# Altium schematic sheet Charging-Sheet.SchDoc
size A4; SheetNumber: 6; SheetTotal: 6
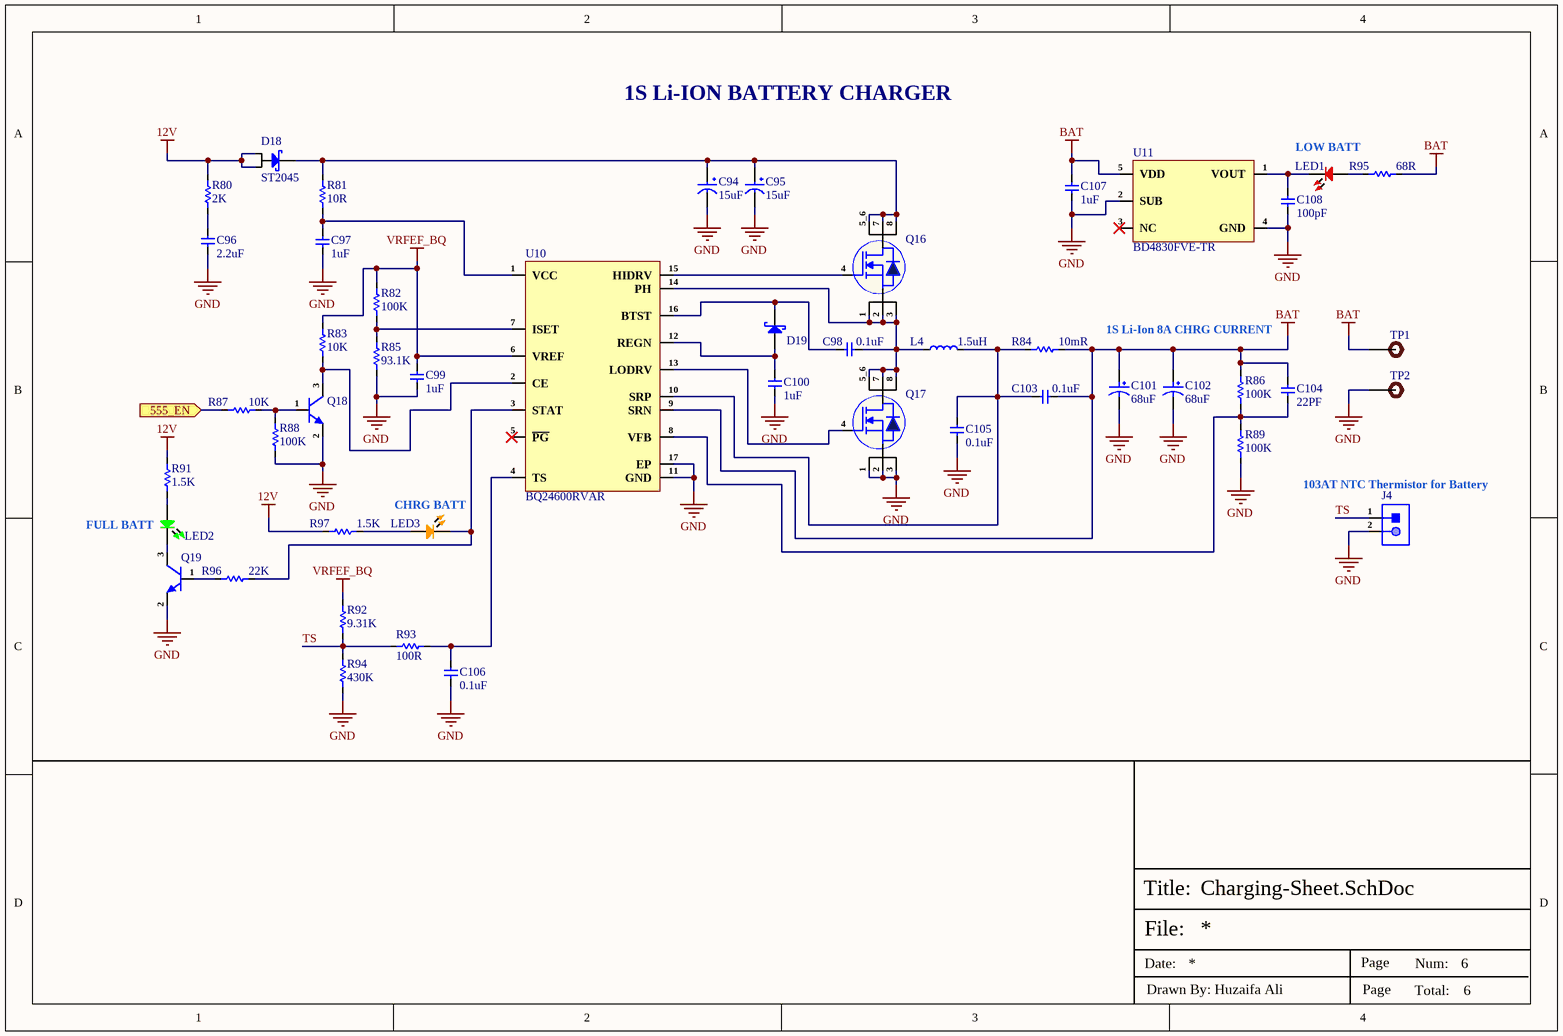
[diagram p0: Charging-Sheet.SchDoc]

## Parts
C94  15uF  [UUD1V150MCL1GS]
C95  15uF  [UUD1V150MCL1GS]
C96  2.2uF  [Cap-0603]
C97  1uF  [Cap-0603]
C98  0.1uF  [CAP-0603]
C99  1uF  [Cap-0603]
C100  1uF  [Cap-0603]
C101  68uF  [50SVPF68M]
C102  68uF  [50SVPF68M]
C103  0.1uF  [CAP-0603]
C104  22PF  [Cap-0402]
C105  0.1uF  [CAP-0603]
C106  0.1uF  [CAP-0603]
C107  1uF  [Cap-0603]
C108  100pF  [Cap-0402]
D18  ST2045  [TO-277]
D19  SS24A  [SMA]  (value not drawn)
J4  X6511WV-02H-C60D30  [HDR1X2_]  (value not drawn)
L4  1.5uH  [FAUL1350-1R5MT]
LED1  RED  [LED-0603]  (value not drawn)
LED2  Emerald  [LED-0603]  (value not drawn)
LED3  NCD0603O2  [LED-0603]  (value not drawn)
Q16  SIR426DP-T1-GE3  [PowerPAK-SO-8]  (value not drawn)
Q17  SIR426DP-T1-GE3  [PowerPAK-SO-8]  (value not drawn)
Q18  MMBT3904M  [SOT-723]  (value not drawn)
Q19  MMBT3904M  [SOT-723]  (value not drawn)
R80  2K  [Res-0603]
R81  10R  [Res-0603]
R82  100K  [Res-0603]
R83  10K  [Res-0603]
R84  10mR  [RES-2512]
R85  93.1K  [Res-0603]
R86  100K  [Res-0603]
R87  10K  [Res-0402]
R88  100K  [Res-0402]
R89  100K  [Res-0603]
R91  1.5K  [Res-0402]
R92  9.31K  [Res-0603]
R93  100R  [Res-0603]
R94  430K  [Res-0603]
R95  68R  [Res-0201]
R96  22K  [Res-0201]
R97  1.5K  [Res-0402]
TP1  Th Hole Test Point (3.7mm Drill 6mm pad)  [Th Hole Test Point (3.7mm Drill 6mm pad)]  (value not drawn)  (no BOM)
TP2  Th Hole Test Point (3.7mm Drill 6mm pad)  [Th Hole Test Point (3.7mm Drill 6mm pad)]  (value not drawn)  (no BOM)
U10  BQ24600RVAR  [QFN-16-EP(3.6x3.6)]
U11  BD4830FVE-TR  [5-VSOF]

## Ports
555_EN (in, see Relay-Switch-Sheet[2B])

## Nets
12V: D18.1(A1) D18.3(A2) R80.2 R91.2 R97.2
BAT: C101.1 C102.1 C103.1 C104.2 C107.2 R84.2 R86.2 R95.2 TP1.1 U10.9(SRN) U11.5(VDD)
GND: C94.2 C95.2 C96.2 C97.1 C99.1 C100.1 C101.2 C102.2 C105.2 C106.2 C107.1 C108.1 J4.2 Q17.1(S) Q17.2(S) Q17.3(S) Q18.2(E) Q19.2(E) R85.1 R88.1 R89.1 R94.1 TP2.1 U10.11(GND) U10.17(EP) U11.2(SUB) U11.4(GND)
VRFEF_BQ: C99.2 R82.2 R83.2 R92.2 U10.6(VREF)
555_EN: R87.2 ; port 555_EN
TS: J4.1 R92.1 R93.1 R94.2
NetC94_1: C94.1 C95.1 D18.2(K) Q16.5_6(D) Q16.7(D) Q16.8(D) R81.2
NetC96_1: C96.1 R80.1
NetC97_2: C97.2 R81.1 U10.1(VCC)
NetC98_1: C98.1 L4.1 Q16.1(S) Q16.2(S) Q16.3(S) Q17.5_6(D) Q17.7(D) Q17.8(D) U10.14(PH)
NetC98_2: C98.2 D19.1(K) U10.16(BTST)
NetC100_2: C100.2 D19.2(A) U10.12(REGN)
NetC103_2: C103.2 C105.1 L4.2 R84.1 U10.10(SRP)
NetC104_1: C104.1 R86.1 R89.2 U10.8(VFB)
NetC106_1: C106.1 R93.2 U10.4(TS)
NetC108_2: C108.2 LED1.2 U11.1(VOUT)
NetLED1_1: LED1.1 R95.1
NetLED2_1: LED2.1 R91.1
NetLED2_2: LED2.2 Q19.3(C)
NetLED3_1: LED3.1 R97.1
NetLED3_2: LED3.2 R96.2 U10.3(STAT)
NetQ16_4: Q16.4(G) U10.15(HIDRV)
NetQ17_4: Q17.4(G) U10.13(LODRV)
NetQ18_1: Q18.1(B) R87.1 R88.2
NetQ18_3: Q18.3(C) R83.1 U10.2(CE)
NetQ19_1: Q19.1(B) R96.1
NetR82_1: R82.1 R85.2 U10.7(ISET)

Not connected (* = marked no-connect by the designer): U10 5(~{PG})*; U11 3(NC)*

## Notes on the sheet
- 1S Li-ION BATTERY CHARGER
- LOW BATT
- 1S Li-Ion 8A CHRG CURRENT
- FULL BATT
- (near LED3) CHRG BATT
- (near J4) 103AT NTC Thermistor for Battery
- File:
- Title:
- Date:
- Page
- Num:
- Total:
- Drawn By: Huzaifa Ali

## Library data of the parts
C94 C95 = UUD1V150MCL1GS: CAP ALUM 15UF 20% 35V SMD; Manufacturer: Nichicon; Dielectric Material: Aluminium; Ripple Current: 150mA; Impedance: 760mR; Leakage Current: 5.25uA; Life (Hours): 2000Hour; Item Type: Capacitor; Supplier 1: Arrow Electronics; Manufacturer Part Number: UUD1V150MCL1GS; RoHS: Yes; Category: Aluminum Electrolytic Capacitors; Stock 1: 1; Pricing 1: 1=0.1001 (USD); Case/Package: Radial; Pins: 2; Min Operating Temperature: -55°C; Max Operating Temperature: 105°C; Package Quantity: 1000; Voltage Rating (DC): 35V; Tolerance: 20%; Packaging: Tape and Reel; Value: 15uF; Voltage Rating: 35V; Termination: SMD/SMT; Series: UD; Construction: Cylindrical; Diameter: 5mm; Length: 5.8mm; Height: 5.8mm; Radiation Hardening: No; Lead Free: Lead Free; RoHS Compliant: Yes; ComponentLink1URL: https://datasheet.ciiva.com/96/e-ud-96810.pdf?src-supplier=Digi-Key; ComponentLink1Description: https://datasheet.ciiva.com/96/e-ud-96810.pdf?src-supplier=Digi-Key; ComponentLink2URL: https://datasheet.ciiva.com/96/e-ud-96811.pdf?src-supplier=Digi-Key; ComponentLink2Description: https://datasheet.ciiva.com/96/e-ud-96811.pdf?src-supplier=Digi-Key; ComponentLink3URL: https://datasheet.ciiva.com/96/e-ud-96812.pdf?src-supplier=Digi-Key; ComponentLink3Description: https://datasheet.ciiva.com/96/e-ud-96812.pdf?src-supplier=Digi-Key; Supplier Part Number 1: UUD1V150MCL1GS; LCSC Part Number: C445253
C96 = GRM188R6YA225KA12D: CAP, 2.2µF, 35V, 10%, X5R, 0603; Manufacturer: Murata; Material: Ceramic; Item Type: Capacitor; Supplier 1: Digi-Key; Manufacturer Part Number: GRM188R6YA225KA12D; RoHS: Yes; Category: Ceramic Capacitors; Stock 1: 81665; Pricing 1: 1=0.21000, 10=0.14100, 50=0.08480, 100=0.07170, 500=0.04904, 1000=0.04338 (USD); Mount: Surface Mount; Case/Package: 0603; Case Code (Metric): 1608; Case Code (Imperial): 0603; Weight: 0.000222oz; Min Operating Temperature: -55°C; Max Operating Temperature: 85°C; Package Quantity: 4000; Packaging: Tape and Reel; Capacitance: 2.2uF; Tolerance: 10%; Voltage Rating: 35V; Dielectric: X5R; Voltage: 35V; Termination: SMD/SMT; Voltage Rating (DC): 35V; Series: GRM; Length: 1.6mm; Width: 0.8mm; Height: 0.8mm; Thickness: 0.035inch; Depth: 0.8mm; REACH SVHC: No SVHC; Lead Free: Lead Free; RoHS Compliant: Yes; ComponentLink1URL: https://datasheet.ciiva.com/14906/partnumbering-e-01-14906490.pdf?src-supplier=Digi-Key; ComponentLink1Description: https://datasheet.ciiva.com/14906/partnumbering-e-01-14906490.pdf?src-supplier=Digi-Key; ComponentLink2URL: https://datasheet.ciiva.com/14906/partnumbering-e-01-14906491.pdf?src-supplier=Digi-Key; ComponentLink2Description: https://datasheet.ciiva.com/14906/partnumbering-e-01-14906491.pdf?src-supplier=Digi-Key; ComponentLink3URL: https://datasheet.ciiva.com/14906/partnumbering-e-01-14906492.pdf?src-supplier=Digi-Key; ComponentLink3Description: https://datasheet.ciiva.com/14906/partnumbering-e-01-14906492.pdf?src-supplier=Digi-Key; Supplier Part Number 1: 490-7204-1-ND; LCSC Part Number: C86017
C97 C99 C100 C107 = CL10A105KB8NNNC: CAP CER 1UF 50V X5R 0603; Manufacturer: Samsung; Material: 4241ConductorMaterial; Tolerance: 10%; Item Type: Capacitor; Supplier: Avnet; Supplier Part Number: CL10A105KB8NNNC; Manufacturer Part Number: CL10A105KB8NNNC; RoHS: Yes; Category: Ceramic Capacitors; Stock: 780446; Pricing: 4000=0.01632, 8000=0.01595, 16000=0.01557, 24000=0.0152, 32000=0.01482 (USD); Mounting Technology: Surface Mount; Case/Package: 0603; Case Code (Metric): 1608; Case Code (Imperial): 0603; Min Operating Temperature: -55°C; Max Operating Temperature: 85°C; Packaging: Tape and Reel; Value: 1uF; Voltage Rating: 50V; Dielectric: X5R; Series: CL; Voltage Rating (DC): 50V; Length: 1.6mm; Depth: 0.8mm; Radiation Hardening: No; RoHS Compliant: Yes; ComponentLink1URL: https://datasheet.ciiva.com/26877/getdatasheetpartid-753736-26877879.pdf?src-supplier=Verical; ComponentLink1Description: https://datasheet.ciiva.com/26877/getdatasheetpartid-753736-26877879.pdf?src-supplier=Verical; LCSC Part Number: C15849
C98 C103 C105 C106 = CL10B104KB8NNNL: CAP CER 0.1UF 50V X7R 0603; Manufacturer: Samsung; Capacitance: 100nF; Tolerance: 10%; Item Type: Capacitor; Supplier 1: Digi-Key; Manufacturer Part Number: CL10B104KB8NNNL; Stock 1: 3731229; Pricing 1: 1=0.1, 10=0.03, 50=0.0164, 100=0.0134, 500=0.00958, 1000=0.00753, 2500=0.00684, 5000=0.0063 (USD); Mount: Surface Mount; Case/Package: 0603; Min Operating Temperature: -55°C; Max Operating Temperature: 125°C; Dielectric: X7R; Packaging: Tape and Reel; Package Quantity: 15000; Voltage Rating: 50V; Voltage Rating (DC): 50V; Series: CL; Construction: Flat; Length: 1.6mm; Width: 0.031inch; Height: 0.8mm; Thickness: 0.035inch; Depth: 0.8mm; Radiation Hardening: No; RoHS Compliant: Yes; ComponentLink1URL: https://www.verical.com/server-webapp/html/getDatasheet?partID=357523&src-supplier=Verical; ComponentLink1Description: https://www.verical.com/server-webapp/html/getDatasheet?partID=357523&src-supplier=Verical; ComponentLink2URL: https://media.digikey.com/pdf/Data%20Sheets/Samsung%20PDFs/CL_Series_MLCC_ds.pdf?src-supplier=Digi-Key; ComponentLink2Description: https://media.digikey.com/pdf/Data%20Sheets/Samsung%20PDFs/CL_Series_MLCC_ds.pdf?src-supplier=Digi-Key; Supplier Part Number 1: 1276-CL10B104KB8NNNLCT-ND; LCSC Part Number: C913912
C101 C102 = 50SVPF68M: CAP ALUM POLY 68UF 20% 50V SMD; Manufacturer: Panasonic; Item Type: Capacitors; Material: 4242ConductorMaterial; Supplier: Future Electronics; LCSC Part Number: C178375; Manufacturer Part Number: 50SVPF68M; RoHS: Yes; Stock: 8800; Pricing: 400=1.08, 800=1.05, 1200=1.03, 1600=1.02, 2000=0.985 (USD); ComponentLink1URL: https://datasheet.ciiva.com/25761/1734360-25761295.pdf?src-supplier=Farnell; ComponentLink1Description: https://datasheet.ciiva.com/25761/1734360-25761295.pdf?src-supplier=Farnell; ComponentLink2URL: https://datasheet.ciiva.com/24071/svpf-os-262415-24071528.pdf?src-supplier=Mouser; ComponentLink2Description: https://datasheet.ciiva.com/24071/svpf-os-262415-24071528.pdf?src-supplier=Mouser; ComponentLink3URL: https://datasheet.ciiva.com/22746/1734360-22746280.pdf?src-supplier=Element14; ComponentLink3Description: https://datasheet.ciiva.com/22746/1734360-22746280.pdf?src-supplier=Element14
C104 = CC0402JRNPO9BN220: CAP CER 22PF 50V C0G/NPO 0402; Manufacturer: Yageo; Dielectric Material: Ceramic; Tolerance: 5%; Dielectric: C0G; Temperature Coefficient: 30ppm/°C; Insulation Resistance: 100GR; Item Type: Capacitor; Supplier 1: Future Electronics; Manufacturer Part Number: CC0402JRNPO9BN220; RoHS: Yes; Category: Ceramic Capacitors; Stock 1: 200000; Pricing 1: 10000=0.00220, 40000=0.00210, 150000=0.00200, 400000=0.00190, 1000000=0.00180 (USD); Mounting Technology: Surface Mount; Case/Package: 0402; Pins: 2; Case Code (Metric): 1005; Case Code (Imperial): 0402; Min Operating Temperature: -55°C; Max Operating Temperature: 125°C; Value: 22pF; Voltage Rating: 50V; Packaging: Tape and Reel; Package Quantity: 1; Voltage Rating (DC): 50V; Termination: SMD/SMT; Resistor Type: Ceramic; Voltage: 50V; Series: CC; Length: 1mm; Width: 0.02inch; Height: 0.5mm; Thickness: 0.022inch; Depth: 0.5mm; Radiation Hardening: No; Reach SVHC Compliant: Yes; Lead Free: Lead Free; RoHS Compliant: Yes; ComponentLink1URL: https://datasheet.ciiva.com/5789/1443161-5789509.pdf?src-supplier=Farnell; ComponentLink1Description: https://datasheet.ciiva.com/5789/1443161-5789509.pdf?src-supplier=Farnell; ComponentLink2URL: https://datasheet.ciiva.com/8033/1443161-8033606.pdf?src-supplier=Element14; ComponentLink2Description: https://datasheet.ciiva.com/8033/1443161-8033606.pdf?src-supplier=Element14; ComponentLink3URL: https://datasheet.ciiva.com/7656/1132289-7656615.pdf?src-supplier=Element14; ComponentLink3Description: https://datasheet.ciiva.com/7656/1132289-7656615.pdf?src-supplier=Element14; ComponentLink4URL: https://datasheet.ciiva.com/8033/1443161-8033607.pdf?src-supplier=Element14; ComponentLink4Description: https://datasheet.ciiva.com/8033/1443161-8033607.pdf?src-supplier=Element14; ComponentLink5URL: https://datasheet.ciiva.com/8033/1443161-8033605.pdf?src-supplier=Element14; ComponentLink5Description: https://datasheet.ciiva.com/8033/1443161-8033605.pdf?src-supplier=Element14; ComponentLink6URL: https://datasheet.ciiva.com/143/mlccorderingcode-143987.pdf?src-supplier=Digi-Key; ComponentLink6Description: https://datasheet.ciiva.com/143/mlccorderingcode-143987.pdf?src-supplier=Digi-Key; ComponentLink7URL: https://datasheet.ciiva.com/143/mlccorderingcode-143986.pdf?src-supplier=Digi-Key; ComponentLink7Description: https://datasheet.ciiva.com/143/mlccorderingcode-143986.pdf?src-supplier=Digi-Key; ComponentLink8URL: https://datasheet.ciiva.com/143/mlccorderingcode-143988.pdf?src-supplier=Digi-Key; ComponentLink8Description: https://datasheet.ciiva.com/143/mlccorderingcode-143988.pdf?src-supplier=Digi-Key; ComponentLink9URL: https://datasheet.ciiva.com/5425/upy-gp-np0-16v-to-50v-8-5425483.pdf?src-supplier=Mouser; ComponentLink9Description: https://datasheet.ciiva.com/5425/upy-gp-np0-16v-to-50v-8-5425483.pdf?src-supplier=Mouser; ComponentLink10URL: https://datasheet.ciiva.com/15189/getdatasheetpartid-370074-15189117.pdf?src-supplier=Verical; ComponentLink10Description: https://datasheet.ciiva.com/15189/getdatasheetpartid-370074-15189117.pdf?src-supplier=Verical; Supplier Part Number 1: 9105957; LCSC Part Number: C106203
C108 = CC0402JRNPO9BN101: CAP CER 100PF 50V C0G/NPO 0402; Manufacturer: Yageo; Dielectric Material: Ceramic; Tolerance: 5%; Dielectric: C0G; Temperature Coefficient: 30ppm/°C; Insulation Resistance: 100GR; Item Type: Capacitor; Supplier: Future Electronics; Supplier Part Number: 8934564; Manufacturer Part Number: CC0402JRNPO9BN101; RoHS: Yes; Category: Ceramic Capacitors; Stock: 11720000; Pricing: 10000=0.002, 40000=0.0019, 150000=0.0018, 400000=0.0018, 1000000=0.0017 (USD); Mounting Technology: Surface Mount; Case/Package: 0402; Pins: 2; Case Code (Imperial): 0402; Case Code (Metric): 1005; Min Operating Temperature: -55°C; Max Operating Temperature: 125°C; Value: 100pF; Voltage Rating: 50V; Voltage Rating (DC): 50V; Packaging: Tape and Reel; Package Quantity: 1; Termination: SMD/SMT; Voltage: 50V; Series: CC; Length: 1mm; Width: 0.02inch; Height: 0.5mm; Thickness: 0.022inch; Depth: 0.5mm; Radiation Hardening: No; RoHS Compliant: Yes; Reach SVHC Compliant: No; Lead Free: Lead Free; ComponentLink1URL: https://datasheet.ciiva.com/11786/0900766b80d84fbf-11786101.pdf?src-supplier=Rs; ComponentLink1Description: https://datasheet.ciiva.com/11786/0900766b80d84fbf-11786101.pdf?src-supplier=Rs; ComponentLink2URL: https://datasheet.ciiva.com/23767/25787-23767888.pdf?src-supplier=Newark; ComponentLink2Description: https://datasheet.ciiva.com/23767/25787-23767888.pdf?src-supplier=Newark; ComponentLink3URL: https://datasheet.ciiva.com/28450/1443161-28450220.pdf?src-supplier=Element14; ComponentLink3Description: https://datasheet.ciiva.com/28450/1443161-28450220.pdf?src-supplier=Element14; ComponentLink4URL: https://datasheet.ciiva.com/8033/1443161-8033598.pdf?src-supplier=Element14; ComponentLink4Description: https://datasheet.ciiva.com/8033/1443161-8033598.pdf?src-supplier=Element14; ComponentLink5URL: https://datasheet.ciiva.com/143/mlccorderingcode-143990.pdf?src-supplier=Digi-Key; ComponentLink5Description: https://datasheet.ciiva.com/143/mlccorderingcode-143990.pdf?src-supplier=Digi-Key; ComponentLink6URL: https://datasheet.ciiva.com/143/mlccorderingcode-143989.pdf?src-supplier=Digi-Key; ComponentLink6Description: https://datasheet.ciiva.com/143/mlccorderingcode-143989.pdf?src-supplier=Digi-Key; ComponentLink7URL: https://datasheet.ciiva.com/143/mlccorderingcode-143991.pdf?src-supplier=Digi-Key; ComponentLink7Description: https://datasheet.ciiva.com/143/mlccorderingcode-143991.pdf?src-supplier=Digi-Key; LCSC Part Number: C106200
D18 = ST2045: 45V Independent Type 20A 470mV@20A TO-277 Schottky Diodes ROHS; Manufacturer: MDD; Item Type: Diode; Manufacturer Part Number: ST2045; Package: TO-277; LCSC Part Number: C840773; ComponentLink1Description: LCSC; ComponentLink1URL: https://www.lcsc.com/product-detail/Schottky-Diodes_MDD-Microdiode-Semiconductor-ST2045_C840773.html
D19 = SS24A: 40V 500mV@2A 2A SMA(DO-214AC) Schottky Barrier Diodes (SBD) ROHS; Manufacturer: Guangdong Hottech; Manufacturer Part Number: SS24A; Package: SMA(DO-214AC); LCSC Part Number: C2886579; ComponentLink1Description: LCSC; ComponentLink1URL: https://www.lcsc.com/product-detail/Schottky-Barrier-Diodes-SBD_Guangdong-Hottech-SS24A_C2886579.html
J4 = X6511WV-02H-C60D30: Gold 250V 3A Straight Square Pins 2.5mm 2P 260℃ 6mm -40℃~+105℃ 3mm 2.54mm Plugin Black Brass 1x2P Plugin,P=2.54mm Pin Headers ROHS; Manufacturer: XKB; Item Type: Male Header; Manufacturer Part Number: X6511WV-02H-C60D30; Package: Plugin,P=2.54mm; LCSC Part Number: C706874; ComponentLink1Description: LCSC; ComponentLink1URL: https://www.lcsc.com/product-detail/Pin-Headers_XKB-Connectivity-X6511WV-02H-C60D30_C706874.html
L4 = FAUL1350-1R5MT: 23A 1.5uH Integrated molded inductor ±20% 33A SMD,12.6x13.5mm Power Inductors ROHS; Manufacturer: cjiang; Manufacturer Part Number: FAUL1350-1R5MT; Package: SMD,12.6x13.5mm; LCSC Part Number: C5298318; Item Type: Inductors; ComponentLink1Description: LCSC; ComponentLink1URL: https://www.lcsc.com/product-detail/Power-Inductors_cjiang-Changjiang-Microelectronics-Tech-FAUL1350-1R5MT_C5298318.html
LED1 = NCD0603R3: RED LED 0603 Light Emitting Diodes; Manufacturer: Foshan NationStar Optoelectronics; Manufacturer Part Number: NCD0603R3; Package: 0603; Item Type: LED; LCSC Part Number: C3151730; ComponentLink1Description: LCSC; ComponentLink1URL: https://www.lcsc.com/product-detail/Light-Emitting-Diodes-LED_Foshan-NationStar-Optoelectronics-NCD0603R3_C3151730.html
LED2 = NCD0603G2: Emerald 0603 Light Emitting Diodes (LED) ROHS; Manufacturer: Foshan NationStar Optoelectronics; Manufacturer Part Number: NCD0603G2; Package: 0603; LCSC Part Number: C87326; Item Type: LED; ComponentLink1Description: LCSC; ComponentLink1URL: https://www.lcsc.com/product-detail/Light-Emitting-Diodes-LED_Foshan-NationStar-Optoelectronics-NCD0603G2_C87326.html
LED3 = NCD0603O2: 20mA 100mcd~220mcd 600nm~610nm -30℃~+85℃ Orange 130° 65mW 1.6V~2.6V 0603 Light Emitting Diodes (LED) ROHS; Manufacturer: FOSHAN Nationstar Optoelectronics; Supplier: LCSC; LCSC Part Number: C108553; Manufacturer Part Number: NCD0603O2; RoHS: No; Item Type: LED
Q16 Q17 = SIR426DP-T1-GE3: MOSFET N-CH 40V 30A PPAK SO-8; Manufacturer: Vishay; Item Type: MOSFETs; Supplier: Mouser; LCSC Part Number: C52893; Manufacturer Part Number: SIR426DP-T1-GE3; RoHS: Yes; Stock: 68474; Pricing: 1=1, 10=0.818, 50=0.818, 100=0.637, 1000=0.44, 10000=0.375 (USD); Height: 1.12mm; Lead Free: 5697LeadFree; ComponentLink1URL: https://datasheet.ciiva.com/6387/sir426dp-6387168.pdf?src-supplier=Digikey; ComponentLink1Description: https://datasheet.ciiva.com/6387/sir426dp-6387168.pdf?src-supplier=Digikey; ComponentLink2URL: https://datasheet.ciiva.com/4440/sir426dp-244407-4440641.pdf?src-supplier=Mouser; ComponentLink2Description: https://datasheet.ciiva.com/4440/sir426dp-244407-4440641.pdf?src-supplier=Mouser; ComponentLink3URL: https://datasheet.ciiva.com/28599/1750667-28599683.pdf?src-supplier=Element14; ComponentLink3Description: https://datasheet.ciiva.com/28599/1750667-28599683.pdf?src-supplier=Element14; ComponentLink4URL: https://datasheet.ciiva.com/5774/sir426dp-5774022.pdf?src-supplier=Farnell; ComponentLink4Description: https://datasheet.ciiva.com/5774/sir426dp-5774022.pdf?src-supplier=Farnell; ComponentLink5URL: https://datasheet.ciiva.com/6387/sir426dp-6387166.pdf?src-supplier=Digikey; ComponentLink5Description: https://datasheet.ciiva.com/6387/sir426dp-6387166.pdf?src-supplier=Digikey; ComponentLink6URL: https://datasheet.ciiva.com/11159/sir426dp-11159834.pdf?src-supplier=Avnet; ComponentLink6Description: https://datasheet.ciiva.com/11159/sir426dp-11159834.pdf?src-supplier=Avnet; ComponentLink7URL: https://datasheet.ciiva.com/16486/sir426dp-16486778.pdf?src-supplier=Future+Electronics; ComponentLink7Description: https://datasheet.ciiva.com/16486/sir426dp-16486778.pdf?src-supplier=Future+Electronics
Q18 Q19 = MMBT3904M: 40V 100mW 100@10mA,1V 200mA 300MHz 300mV@50mA,5mA NPN -55℃~+150℃@(Tj) SOT-723 Bipolar Transistors - BJT ROHS; Manufacturer: TECH PUBLIC; Item Type: Mosfet; ComponentLink1Description: LCSC; ComponentLink1URL: https://www.lcsc.com/product-detail/Bipolar-Transistors-BJT_TECH-PUBLIC-MMBT3904M_C2923360.html; Manufacturer Part Number: MMBT3904M; Package: SOT-723; LCSC Part Number: C2923360
R80 = RC0603FR-072KL: RES SMD 2K OHM 1% 1/10W 0603; Manufacturer: Yageo; Resistance: 2kR; Temperature Coefficient: 100ppm/°C; Voltage Rating (DC): 50V; Power Rating: 100mW; Working Voltage: 75V; Supplier 1: Digi-Key; Manufacturer Part Number: RC0603FR-072KL; Stock 1: 8782961; Pricing 1: 1=0.1, 10=0.023, 100=0.0094, 1000=0.00421, 2500=0.00366 (USD); Case/Package: 0603; Number of Pins: 2; Case Code (Metric): 1608; Case Code (Imperial): 0603; Min Operating Temperature: -55°C; Max Operating Temperature: 155°C; Tolerance: 1%; Composition: Thick Film; Packaging: Tape and Reel; Voltage Rating: 50V; Package Quantity: 1; Number of Terminations: 2; Termination: SMD/SMT; Military Standard: Not; Max Power Dissipation: 100mW; Features: Moisture Resistant; Length: 1.6mm; Height: 0.45mm; Width: 0.031inch; Depth: 0.8mm; Lead Free: Lead Free; REACH SVHC: No SVHC; ComponentLink1URL: http://www.farnell.com/datasheets/2167052.pdf?src-supplier=Element14; ComponentLink1Description: http://www.farnell.com/datasheets/2167052.pdf?src-supplier=Element14; ComponentLink2URL: http://documents.rs-components.com/techlib://itc_doclist_GB.htm?stockno=5050139&src-supplier=RSComponents; ComponentLink2Description: http://documents.rs-components.com/techlib://itc_doclist_GB.htm?stockno=5050139&src-supplier=RSComponents; ComponentLink3URL: http://www.yageo.com/documents/recent/PYu-RC_Group_51_RoHS_L_10.pdf?src-supplier=Digi-Key; ComponentLink3Description: http://www.yageo.com/documents/recent/PYu-RC_Group_51_RoHS_L_10.pdf?src-supplier=Digi-Key; ComponentLink4URL: http://www.mouser.com/catalog/specsheets/RC0603.pdf?src-supplier=Mouser; ComponentLink4Description: http://www.mouser.com/catalog/specsheets/RC0603.pdf?src-supplier=Mouser; Supplier Part Number 1: 311-2.00KHRCT-ND; LCSC Part Number: C105576
R81 = RC0603FR-0710RL: RES SMD 10 OHM 1% 1/10W 0603; Manufacturer: Yageo; Temperature Coefficient: 200ppm/°C; Power Rating: 100mW; Voltage Rating: 50V; Item type: Resistor; Supplier 1: Digi-Key; Manufacturer Part Number: RC0603FR-0710RL; Stock 1: 10836596; Pricing 1: 1=0.1, 10=0.046, 100=0.0187, 1000=0.0084, 2500=0.00729 (USD); Case/Package: 0603; Number of Pins: 2; Case Code (Imperial): 0603; Case Code (Metric): 1608; Contact Plating: Tin,Matte; Min Operating Temperature: -55°C; Max Operating Temperature: 155°C; Resistance: 10R; Tolerance: 1%; Composition: Thick Film; Packaging: Tape and Reel; Voltage Rating (DC): 50V; Termination: SMD/SMT; Military Standard: Not; Length: 1.6mm; Height: 0.45mm; Width: 0.8mm; Depth: 0.8mm; Radiation Hardening: No; Lead Free: Lead Free; REACH SVHC: No SVHC; ComponentLink1URL: http://www.farnell.com/datasheets/1868787.pdf?src-supplier=Element14; ComponentLink1Description: http://www.farnell.com/datasheets/1868787.pdf?src-supplier=Element14; ComponentLink2URL: http://www.yageo.com/documents/recent/PYu-RC0603_51_RoHS_L_4.pdf?src-supplier=Avnet; ComponentLink2Description: http://www.yageo.com/documents/recent/PYu-RC0603_51_RoHS_L_4.pdf?src-supplier=Avnet; ComponentLink3URL: http://documents.rs-components.com/techlib://itc_doclist_GB.htm?stockno=5048984&src-supplier=RSComponents; ComponentLink3Description: http://documents.rs-components.com/techlib://itc_doclist_GB.htm?stockno=5048984&src-supplier=RSComponents; ComponentLink4URL: http://www.yageo.com/documents/recent/PYu-RC0603_51_RoHS_L_4.pdf?src-supplier=Avnet+Europe; ComponentLink4Description: http://www.yageo.com/documents/recent/PYu-RC0603_51_RoHS_L_4.pdf?src-supplier=Avnet+Europe; Supplier Part Number 1: 311-10.0HRDKR-ND; LCSC Part Number: C109318
R82 R86 R89 = RT0603BRD07100KL: RES SMD 100K OHM 0.1% 1/10W 0603; Manufacturer: Yageo; Resistance: 100kR; Temperature Coefficient: 25ppm/°C; Voltage Rating (DC): 75V; Power Rating: 100mW; Item Type: Resistor; Supplier 1: Digi-Key; Manufacturer Part Number: RT0603BRD07100KL; Stock 1: 53395; Pricing 1: 1=0.39, 10=0.332, 100=0.1298, 1000=0.05435, 2500=0.04982 (USD); Mount: Surface Mount; Case/Package: 0603; Case Code (Imperial): 0603; Case Code (Metric): 1608; Min Operating Temperature: -55°C; Max Operating Temperature: 125°C; Tolerance: 0.1%; Composition: Thin Film; Packaging: Tape and Reel; Voltage Rating: 75V; Package Quantity: 5000; Termination: SMD/SMT; Number of Terminations: 2; Military Standard: Not; Max Power Dissipation: 100mW; Working Voltage: 75V; Features: Moisture Resistant; Length: 1.6mm; Height: 0.022inch; Width: 0.031inch; Depth: 0.8mm; Lead Free: Lead Free; ComponentLink1URL: http://documents.rs-components.com/techlib://itc_doclist_GB.htm?stockno=6174810&src-supplier=RSComponents; ComponentLink1Description: http://documents.rs-components.com/techlib://itc_doclist_GB.htm?stockno=6174810&src-supplier=RSComponents; Supplier Part Number 1: YAG1235CT-ND; LCSC Part Number: C122538
R83 = RC0603FR-0710KL: RES SMD 10K Ohm 1% 1/10W 0603; Manufacturer: Yageo; Resistance: 10kR; Temperature Coefficient: 100ppm/°C; Voltage Rating (DC): 50V; Power Rating: 100mW; Voltage Rating: 75V; Item Type: Resistor; Supplier 1: Digi-Key; Manufacturer Part Number: RC0603FR-0710KL; RoHS: Yes; Category: Chip SMD Resistors; Stock 1: 25249139; Pricing 1: 1=0.10000, 10=0.02400, 100=0.00970, 1000=0.00436, 2500=0.00378 (USD); Case/Package: 0603; Number of Pins: 2; Case Code (Imperial): 0603; Case Code (Metric): 1608; Weight: 7.1E-05oz; Size Code: 0603; Min Operating Temperature: -55°C; Max Operating Temperature: 155°C; Tolerance: 1%; Resistor Type: Thick Film; Packaging: Tape and Reel; Termination: SMD/SMT; Features: Moisture Resistant; Series: RC; Max Power Dissipation: 100mW; Number of Terminations: 2; Resistance Tolerance: 1%; Construction: Rectangular; Length: 1.6mm; Width: 0.8mm; Height: 0.45mm; Depth: 0.8mm; Lead Pitch: 0.3mm; REACH SVHC: Unknown; Lead Free: Lead Free; Military Standard: Not; RoHS Compliant: Yes; ComponentLink1URL: https://datasheet.ciiva.com/7660/38590-7660789.pdf?src-supplier=Element14; ComponentLink1Description: https://datasheet.ciiva.com/7660/38590-7660789.pdf?src-supplier=Element14; ComponentLink2URL: https://datasheet.ciiva.com/7983/443971-7983596.pdf?src-supplier=Element14; ComponentLink2Description: https://datasheet.ciiva.com/7983/443971-7983596.pdf?src-supplier=Element14; ComponentLink3URL: https://datasheet.ciiva.com/22747/443971-22747519.pdf?src-supplier=Element14; ComponentLink3Description: https://datasheet.ciiva.com/22747/443971-22747519.pdf?src-supplier=Element14; ComponentLink4URL: https://datasheet.ciiva.com/46440/1868787-46440891.pdf?src-supplier=Element14; ComponentLink4Description: https://datasheet.ciiva.com/46440/1868787-46440891.pdf?src-supplier=Element14; ComponentLink5URL: https://datasheet.ciiva.com/7746/1738695-7746239.pdf?src-supplier=Element14; ComponentLink5Description: https://datasheet.ciiva.com/7746/1738695-7746239.pdf?src-supplier=Element14; ComponentLink6URL: https://datasheet.ciiva.com/15189/getdatasheetpartid-409289-15189591.pdf?src-supplier=Verical; ComponentLink6Description: https://datasheet.ciiva.com/15189/getdatasheetpartid-409289-15189591.pdf?src-supplier=Verical; Supplier Part Number 1: 311-10.0KHRCT-ND; LCSC Part Number: C98220
R84 = PA2512FKE7T0R01E: RES 0.01 OHM 1% 3W 2512; Manufacturer: Yageo; Item Type: Resistor; Supplier: Avnet; LCSC Part Number: C375691; Manufacturer Part Number: PA2512FKE7T0R01E; RoHS: No; Stock: 4000; Pricing: 1=0.926, 25=0.703, 50=0.63, 100=0.557, 250=0.485 (USD)
R85 = RT0603BRD0793K1L: RES SMD 93.1KOHM 0.1% 1/10W 0603; Manufacturer: Yageo; Item Type: Resistors; Supplier: Arrow Electronics; LCSC Part Number: C705799; Manufacturer Part Number: RT0603BRD0793K1L; RoHS: Yes; Stock: 5000; Pricing: 5000=0.0247, 10000=0.0245 (USD); ComponentLink1URL: http://www.mouser.com/ds/2/447/yageodocoutput-1125656.pdf?src-supplier=Mouser; ComponentLink1Description: http://www.mouser.com/ds/2/447/yageodocoutput-1125656.pdf?src-supplier=Mouser; ComponentLink2URL: http://www.yageo.com/documents/recent/PYu-RT_1-to-0.01_RoHS_L_9.pdf?src-supplier=Digikey; ComponentLink2Description: http://www.yageo.com/documents/recent/PYu-RT_1-to-0.01_RoHS_L_9.pdf?src-supplier=Digikey; ComponentLink3URL: https://www.yageo.com/upload/media/product/productsearch/datasheet/rchip/PYu-RT_1-to-0.01_RoHS_L_12.pdf?src-supplier=Digikey; ComponentLink3Description: https://www.yageo.com/upload/media/product/productsearch/datasheet/rchip/PYu-RT_1-to-0.01_RoHS_L_12.pdf?src-supplier=Digikey; ComponentLink4URL: https://datasheet.octopart.com/RT0603BRD0793K1L-Yageo-datasheet-166250672.pdf?src-supplier=Future+Electronics; ComponentLink4Description: https://datasheet.octopart.com/RT0603BRD0793K1L-Yageo-datasheet-166250672.pdf?src-supplier=Future+Electronics
R87 = RC0402FR-0710KL: RES 10K OHM 1% 1/16W 0402; Manufacturer: Yageo; Resistance: 10kR; Voltage Rating (DC): 50V; Temperature Coefficient: 100ppm/°C; Power Rating: 62.5mW; Max Power Dissipation: 63mW; Item Type: Resistor; Supplier 1: Mouser; Manufacturer Part Number: RC0402FR-0710KL; RoHS: Yes; Category: Chip SMD Resistors; Stock 1: 18648329; Pricing 1: 1=0.10000, 10=0.01400, 50=0.01400, 100=0.00500, 1000=0.00300, 10000=0.00200 (USD); Case/Package: 0402; Number of Pins: 2; Case Code (Imperial): 0402; Case Code (Metric): 1005; Min Operating Temperature: -55°C; Max Operating Temperature: 155°C; Resistor Type: Thick Film; Tolerance: 1%; Packaging: Tape and Reel; Voltage Rating: 50V; Termination: SMD/SMT; Working Voltage: 50V; Number of Terminations: 2; Features: Moisture Resistant; Series: RC; Resistance Tolerance: 1%; Construction: Rectangular; Length: 1mm; Width: 0.5mm; Height: 0.32mm; Depth: 0.5mm; Lead Pitch: 0.2mm; REACH SVHC: No SVHC; Lead Free: Lead Free; RoHS Compliant: Yes; Military Standard: Not; ComponentLink1URL: https://datasheet.ciiva.com/7660/38568-7660787.pdf?src-supplier=Element14; ComponentLink1Description: https://datasheet.ciiva.com/7660/38568-7660787.pdf?src-supplier=Element14; ComponentLink2URL: https://datasheet.ciiva.com/7849/1686128-7849814.pdf?src-supplier=Element14; ComponentLink2Description: https://datasheet.ciiva.com/7849/1686128-7849814.pdf?src-supplier=Element14; ComponentLink3URL: https://datasheet.ciiva.com/7983/1018594-7983486.pdf?src-supplier=Element14; ComponentLink3Description: https://datasheet.ciiva.com/7983/1018594-7983486.pdf?src-supplier=Element14; ComponentLink4URL: https://datasheet.ciiva.com/22747/1018594-22747512.pdf?src-supplier=Element14; ComponentLink4Description: https://datasheet.ciiva.com/22747/1018594-22747512.pdf?src-supplier=Element14; ComponentLink5URL: https://datasheet.ciiva.com/12667/pyu-rc0402-51-rohs-l-6-r-12667067.pdf?src-supplier=Mouser; ComponentLink5Description: https://datasheet.ciiva.com/12667/pyu-rc0402-51-rohs-l-6-r-12667067.pdf?src-supplier=Mouser; ComponentLink6URL: https://datasheet.ciiva.com/7849/1784430-7849813.pdf?src-supplier=Element14; ComponentLink6Description: https://datasheet.ciiva.com/7849/1784430-7849813.pdf?src-supplier=Element14; ComponentLink7URL: https://datasheet.ciiva.com/7849/1784430-7849815.pdf?src-supplier=Element14; ComponentLink7Description: https://datasheet.ciiva.com/7849/1784430-7849815.pdf?src-supplier=Element14; Supplier Part Number 1: 603-RC0402FR-0710KL; LCSC Part Number: C60490
R88 = RC0402FR-07100KL: RES 100K OHM 1% 1/16W 0402; Manufacturer: Yageo; Resistance: 100kR; Temperature Coefficient: 100ppm/°C; Power Rating: 63mW; Voltage Rating: 50V; Item Type: Resistor; Supplier 1: Mouser; Manufacturer Part Number: RC0402FR-07100KL; RoHS: Yes; Category: Chip SMD Resistors; Stock 1: 7759549; Pricing 1: 1=0.10000, 10=0.01200, 50=0.01200, 100=0.00500, 1000=0.00300, 2500=0.00200, 10000=0.00100 (USD); Case/Package: 0402; Case Code (Metric): 1005; Case Code (Imperial): 0402; Min Operating Temperature: -55°C; Max Operating Temperature: 155°C; Resistor Type: Thick Film; Tolerance: 1%; Packaging: Tape and Reel; Package Quantity: 1; Number of Terminations: 2; Termination: SMD/SMT; Max Power Dissipation: 63mW; Working Voltage: 50V; Features: Moisture Resistant; Series: RC; Resistance Tolerance: 1%; Construction: Rectangular; Technology: THICK FILM; Length: 0.039inch; Width: 0.02inch; Height: 0.016inch; Depth: 0.5mm; REACH SVHC: No SVHC; Lead Free: Lead Free; RoHS Compliant: Yes; Military Standard: Not; ComponentLink1URL: https://datasheet.ciiva.com/11819/0900766b80c66297-11819452.pdf?src-supplier=RSComponents; ComponentLink1Description: https://datasheet.ciiva.com/11819/0900766b80c66297-11819452.pdf?src-supplier=RSComponents; ComponentLink2URL: https://datasheet.ciiva.com/22747/1018594-22747509.pdf?src-supplier=Element14; ComponentLink2Description: https://datasheet.ciiva.com/22747/1018594-22747509.pdf?src-supplier=Element14; ComponentLink3URL: https://datasheet.ciiva.com/2453/pyu-r-int-thick-7-2453362.pdf?src-supplier=Digi-Key; ComponentLink3Description: https://datasheet.ciiva.com/2453/pyu-r-int-thick-7-2453362.pdf?src-supplier=Digi-Key; ComponentLink4URL: https://datasheet.ciiva.com/2453/pyu-r-int-thick-7-2453363.pdf?src-supplier=Digi-Key; ComponentLink4Description: https://datasheet.ciiva.com/2453/pyu-r-int-thick-7-2453363.pdf?src-supplier=Digi-Key; ComponentLink5URL: https://datasheet.ciiva.com/2453/pyu-r-int-thick-7-2453361.pdf?src-supplier=Digi-Key; ComponentLink5Description: https://datasheet.ciiva.com/2453/pyu-r-int-thick-7-2453361.pdf?src-supplier=Digi-Key; ComponentLink6URL: https://datasheet.ciiva.com/12667/pyu-rc0402-51-rohs-l-6-r-12667930.pdf?src-supplier=Mouser; ComponentLink6Description: https://datasheet.ciiva.com/12667/pyu-rc0402-51-rohs-l-6-r-12667930.pdf?src-supplier=Mouser; ComponentLink7URL: https://datasheet.ciiva.com/15189/getdatasheetpartid-323696-15189334.pdf?src-supplier=Verical; ComponentLink7Description: https://datasheet.ciiva.com/15189/getdatasheetpartid-323696-15189334.pdf?src-supplier=Verical; Supplier Part Number 1: 603-RC0402FR-07100KL; LCSC Part Number: C60491
R91 R97 = RC0402FR-071K5L: RES 1.5K OHM 1% 1/16W 0402; Manufacturer: Yageo; Resistance: 1.5kR; Power Rating: 62.5mW; Voltage Rating: 50V; Temperature Coefficient: 100ppm/°C; Max Power Dissipation: 63mW; Supplier 1: Digi-Key; Manufacturer Part Number: RC0402FR-071K5L; RoHS: Yes; Category: Chip SMD Resistors; Stock 1: 2832947; Pricing 1: 1=0.10000, 10=0.01500, 100=0.00610, 1000=0.00275, 2500=0.00239, 5000=0.00197 (USD); Case/Package: 0402; Case Code (Metric): 1005; Case Code (Imperial): 0402; Size Code: 0402; Min Operating Temperature: -55°C; Max Operating Temperature: 155°C; Resistor Type: Thick Film; Package Quantity: 1; Tolerance: 1%; Packaging: Tape and Reel; Number of Terminations: 2; Termination: SMD/SMT; Features: Moisture Resistant; Series: RC; Resistance Tolerance: 1%; Construction: Rectangular; Technology: THICK FILM; Length: 1mm; Width: 0.02inch; Height: 0.016inch; Depth: 0.5mm; RoHS Compliant: Yes; REACH SVHC: No SVHC; Military Standard: Not; Lead Free: Lead Free; ComponentLink1URL: https://datasheet.ciiva.com/11808/0900766b80c66297-11808238.pdf?src-supplier=RSComponents; ComponentLink1Description: https://datasheet.ciiva.com/11808/0900766b80c66297-11808238.pdf?src-supplier=RSComponents; ComponentLink2URL: https://datasheet.ciiva.com/46394/1018594-46394950.pdf?src-supplier=Element14; ComponentLink2Description: https://datasheet.ciiva.com/46394/1018594-46394950.pdf?src-supplier=Element14; ComponentLink3URL: https://datasheet.ciiva.com/2453/pyu-r-int-thick-7-2453440.pdf?src-supplier=Digi-Key; ComponentLink3Description: https://datasheet.ciiva.com/2453/pyu-r-int-thick-7-2453440.pdf?src-supplier=Digi-Key; ComponentLink4URL: https://datasheet.ciiva.com/2453/pyu-r-int-thick-7-2453441.pdf?src-supplier=Digi-Key; ComponentLink4Description: https://datasheet.ciiva.com/2453/pyu-r-int-thick-7-2453441.pdf?src-supplier=Digi-Key; ComponentLink5URL: https://datasheet.ciiva.com/2453/pyu-r-int-thick-7-2453439.pdf?src-supplier=Digi-Key; ComponentLink5Description: https://datasheet.ciiva.com/2453/pyu-r-int-thick-7-2453439.pdf?src-supplier=Digi-Key; ComponentLink6URL: https://datasheet.ciiva.com/12558/pyu-rc0402-51-rohs-l-6-r-8721-12558542.pdf?src-supplier=Mouser; ComponentLink6Description: https://datasheet.ciiva.com/12558/pyu-rc0402-51-rohs-l-6-r-8721-12558542.pdf?src-supplier=Mouser; ComponentLink7URL: https://datasheet.ciiva.com/7849/1018594-7849863.pdf?src-supplier=Element14; ComponentLink7Description: https://datasheet.ciiva.com/7849/1018594-7849863.pdf?src-supplier=Element14; ComponentLink8URL: https://datasheet.ciiva.com/7849/1018594-7849864.pdf?src-supplier=Element14; ComponentLink8Description: https://datasheet.ciiva.com/7849/1018594-7849864.pdf?src-supplier=Element14; ComponentLink9URL: https://datasheet.ciiva.com/15189/getdatasheetpartid-323992-15189370.pdf?src-supplier=Verical; ComponentLink9Description: https://datasheet.ciiva.com/15189/getdatasheetpartid-323992-15189370.pdf?src-supplier=Verical; Supplier Part Number 1: 311-1.50KLRCT-ND; LCSC Part Number: C114759
R92 = RT0603BRE079K31L: RES SMD 9.31KOHM 0.1% 1/10W 0603; Manufacturer: Yageo; Item Type: Resistors; Value: 9.31kR; Max Power Dissipation: 100mW; Temperature Coefficient: 50ppm/°C; Voltage Rating (DC): 50V; Supplier: Digikey; LCSC Part Number: C862329; Manufacturer Part Number: RT0603BRE079K31L; RoHS: Yes; Pricing: 5000=0.04446 (USD); Case/Package: 0603; Min Operating Temperature: -55°C; Max Operating Temperature: 155°C; Packaging: Tape and Reel; Tolerance: 0.1%; Number of Terminations: 2; Series: RT; Lead Free: Lead Free; RoHS Compliant: Yes; ComponentLink1URL: https://datasheet.ciiva.com/2584/pyu-rt-1-to-0-05-rohs-l-5-2584666.pdf?src-supplier=Digikey; ComponentLink1Description: https://datasheet.ciiva.com/2584/pyu-rt-1-to-0-05-rohs-l-5-2584666.pdf?src-supplier=Digikey
R93 = RC0603FR-07100RL: RES SMD 100 OHM 1% 1/10W 0603; Manufacturer: Yageo; Temperature Coefficient: 100ppm/°C; Voltage Rating (DC): 50V; Power Rating: 100mW; Item Type: Resistor; Supplier 1: Arrow Electronics; Manufacturer Part Number: RC0603FR-07100RL; RoHS: Yes; Category: Chip SMD Resistors; Stock 1: 3800000; Pricing 1: 5000=0.00300, 5000=0.00200, 5000=0.00450, 50000=0.00410, 500000=0.00230, 2500000=0.00140 (USD); Case/Package: 0603; Number of Pins: 2; Case Code (Imperial): 0603; Case Code (Metric): 1608; Size Code: 0603; Min Operating Temperature: -55°C; Max Operating Temperature: 155°C; Resistance: 100R; Tolerance: 1%; Resistor Type: Thick Film; Packaging: Tape and Reel; Voltage Rating: 50V; Termination: SMD/SMT; Features: Moisture Resistant; Series: RC; Max Power Dissipation: 100mW; Number of Terminations: 2; Construction: Rectangular; Resistance Tolerance: 1%; Technology: THICK FILM; Length: 1.6mm; Width: 0.8mm; Height: 0.45mm; Depth: 0.8mm; REACH SVHC: Unknown; Lead Free: Lead Free; RoHS Compliant: Yes; Military Standard: Not; Supplier Part Number 1: RC0603FR-07100RL; LCSC Part Number: C105588
R94 = RT0603BRD07430KL: RES SMD 430K OHM 0.1% 1/10W 0603; Manufacturer: Yageo; Item Type: Resistors; Value: 430kR; Power Rating: 100mW; Voltage Rating: 75V; Temperature Coefficient: 25ppm/°C; Supplier: Digikey; LCSC Part Number: C861400; Manufacturer Part Number: RT0603BRD07430KL; RoHS: Yes; Stock: 3169; Pricing: 1=0.13, 10=0.102, 50=0.081, 100=0.0728, 500=0.0558, 1000=0.04943 (USD); Case/Package: 0603; Case Code (Imperial): 0603; Case Code (Metric): 1608; Weight: 7.1E-05oz; Contact Plating: Tin,Matte; Min Operating Temperature: -55°C; Max Operating Temperature: 125°C; Tolerance: 0.1%; Packaging: Tape and Reel; Number of Terminations: 2; Termination: SMD/SMT; Max Power Dissipation: 100mW; Features: Moisture Resistant; Series: RT; Length: 0.063inch; Width: 0.8mm; Height: 0.022inch; RoHS Compliant: Yes; ComponentLink1URL: https://datasheet.ciiva.com/12809/pyu-rt-1-to-0-05-rohs-l-4-12809605.pdf?src-supplier=Mouser; ComponentLink1Description: https://datasheet.ciiva.com/12809/pyu-rt-1-to-0-05-rohs-l-4-12809605.pdf?src-supplier=Mouser
R95 = 0201WMJ0680TEE: 50mW Thick Film Resistors ±5% ±200ppm/℃ 68Ω 0201 Chip Resistor - Surface Mount ROHS; Manufacturer: UNI-ROYAL; Manufacturer Part Number: 0201WMJ0680TEE; Footprint: 0201; ComponentLink1Description: LCSC; ComponentLink1URL: https://www.lcsc.com/product-detail/Chip-Resistor-Surface-Mount_UNI-ROYAL-Uniroyal-Elec-0201WMJ0680TEE_C473576.html; LCSC Part Number: C473576; Item Type: Resistor
R96 = 0201WMF2202TEE: 50mW Thick Film Resistors ±1% ±200ppm/℃ 22kΩ 0201 Chip Resistor - Surface Mount ROHS; Manufacturer: UNI-ROYAL; Manufacturer Part Number: 0201WMF2202TEE; Package: 0201; LCSC Part Number: C473469; Item Type: Resistor; ComponentLink1Description: LCSC; ComponentLink1URL: https://www.lcsc.com/product-detail/Chip-Resistor-Surface-Mount_UNI-ROYAL-Uniroyal-Elec-0201WMF2202TEE_C473469.html
TP1 TP2 = Th Hole Test Point (3.7mm Drill 6mm pad): -; Manufacturer Part Number: Th Hole Test Point; Item Type: Test Point
U10 = BQ24600RVAR: IC BATT CHG LI-ION 1-6CEL 16VQFN; Manufacturer: Texas Instruments; Supplier: Mouser; LCSC Part Number: C157568; Manufacturer Part Number: BQ24600RVAR; RoHS: Yes; Item Type: IC; Stock: 3970; Pricing: 1=1.88, 10=1.69, 50=1.69, 100=1.36, 1000=0.928, 10000=0.8 (USD); ComponentLink1URL: https://datasheet.ciiva.com/1934/bq24600-1934848.pdf?src-supplier=Digikey; ComponentLink1Description: https://datasheet.ciiva.com/1934/bq24600-1934848.pdf?src-supplier=Digikey; ComponentLink2URL: https://datasheet.ciiva.com/15115/getdatasheetpartid-517716-15115134.pdf?src-supplier=Verical; ComponentLink2Description: https://datasheet.ciiva.com/15115/getdatasheetpartid-517716-15115134.pdf?src-supplier=Verical; ComponentLink3URL: https://datasheet.ciiva.com/3214/bq24600-3214303.pdf?src-supplier=Avnet; ComponentLink3Description: https://datasheet.ciiva.com/3214/bq24600-3214303.pdf?src-supplier=Avnet
U11 = BD4830FVE-TR: Active Low 1 VSOF-5 Monitors & Reset Circuits ROHS; Manufacturer: Rohm; Max Supply Voltage: 10V; Max Power Dissipation: 210mW; Min Supply Voltage: 1.2V; Number of Voltages Monitored: 1; Threshold Voltage: 6V; Accuracy: 1%; Operating Supply Current: 900nA; Max Supply Current: 1.98uA; Watchdog Timer: No; Min Reset Threshold Voltage: 5.91V; Max Reset Threshold Voltage: 6.09V; Item Type: IC; Manufacturer Part Number: BD4830FVE-TR; RoHS: Yes; Category: Voltage Supervisors; Stock 1: 5990; Pricing 1: 1=0.64000, 10=0.54900, 25=0.51200, 100=0.40960, 250=0.38032, 500=0.32182, 1000=0.24868 (USD); Mounting Technology: Surface Mount; Case/Package: VSOF; Pins: 5; Min Operating Temperature: -40°C; Max Operating Temperature: 105°C; Package Quantity: 3000; Packaging: Tape and Reel; Reset: Active Low; Number of Monitored Inputs: 1; Type: Simple Reset/Power-On Reset,Voltage Detector; Series: BD48xxx; Lead Free: Lead Free; RoHS Compliant: Yes; ComponentLink1URL: https://datasheet.ciiva.com/1974/bd48xxg-e-1974994.pdf?src-supplier=Digi-Key; ComponentLink1Description: https://datasheet.ciiva.com/1974/bd48xxg-e-1974994.pdf?src-supplier=Digi-Key; ComponentLink2URL: https://datasheet.ciiva.com/8133/bd48xxg-e-8133113.pdf?src-supplier=Avnet; ComponentLink2Description: https://datasheet.ciiva.com/8133/bd48xxg-e-8133113.pdf?src-supplier=Avnet; LCSC Part Number: C2067200; Supplier 1: Rs; Supplier Part Number 1: 1717448; ComponentLink3Description: LCSC; ComponentLink3URL: https://www.lcsc.com/product-detail/Monitors-Reset-Circuits_ROHM-Semicon-BD4830FVE-TR_C2067200.html